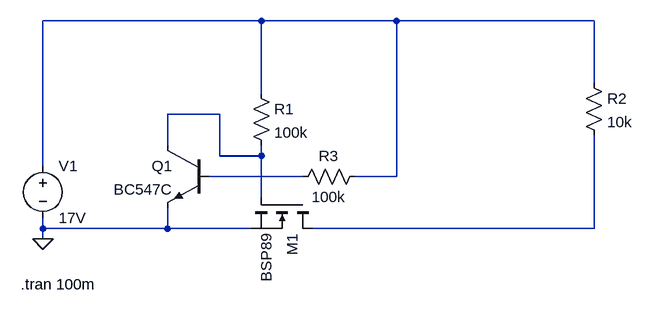
[diagram p0: schematic Disconnector.asc]
Disconnector.asc, the LTspice schematic file:
Version 4
SHEET 1 880 680
WIRE -48 -80 -384 -80
WIRE 160 -80 -48 -80
WIRE 464 -80 160 -80
WIRE 464 16 464 -80
WIRE -48 32 -48 -80
WIRE -112 64 -192 64
WIRE -192 112 -192 64
WIRE -112 128 -112 64
WIRE -48 128 -48 112
WIRE -48 128 -112 128
WIRE -384 144 -384 -80
WIRE 16 160 -128 160
WIRE 160 160 160 -80
WIRE 160 160 96 160
WIRE -48 192 -48 128
WIRE -384 240 -384 224
WIRE -192 240 -192 208
WIRE -192 240 -384 240
WIRE -64 240 -192 240
WIRE 464 240 464 96
WIRE 464 240 32 240
WIRE -384 256 -384 240
FLAG -384 256 0
SYMBOL voltage -384 128 R0
WINDOW 123 0 0 Left 0
WINDOW 39 0 0 Left 0
SYMATTR InstName V1
SYMATTR Value 17V
SYMBOL res 448 0 R0
SYMATTR InstName R2
SYMATTR Value 10k
SYMBOL nmos 32 192 R90
SYMATTR InstName M1
SYMATTR Value BSP89
SYMBOL res -64 16 R0
SYMATTR InstName R1
SYMATTR Value 100k
SYMBOL npn -128 112 M0
SYMATTR InstName Q1
SYMATTR Value BC547C
SYMBOL res 112 144 R90
WINDOW 0 0 56 VBottom 2
WINDOW 3 32 56 VTop 2
SYMATTR InstName R3
SYMATTR Value 100k
TEXT -418 326 Left 2 !.tran 100m

The netlist it stands for:
* Disconnector.asc
V1 N001 0 17V
R2 N001 N004 10k
M1 N004 N002 0 0 BSP89
R1 N001 N002 100k
Q1 N002 N003 0 0 BC547C
R3 N001 N003 100k
.model NPN NPN
.model PNP PNP
.lib standard.bjt
.model NMOS NMOS
.model PMOS PMOS
.lib standard.mos
.tran 100m
.backanno
.end